# Altium schematic sheet connect.SchDoc
size B; SheetNumber: 6; SheetTotal: 6
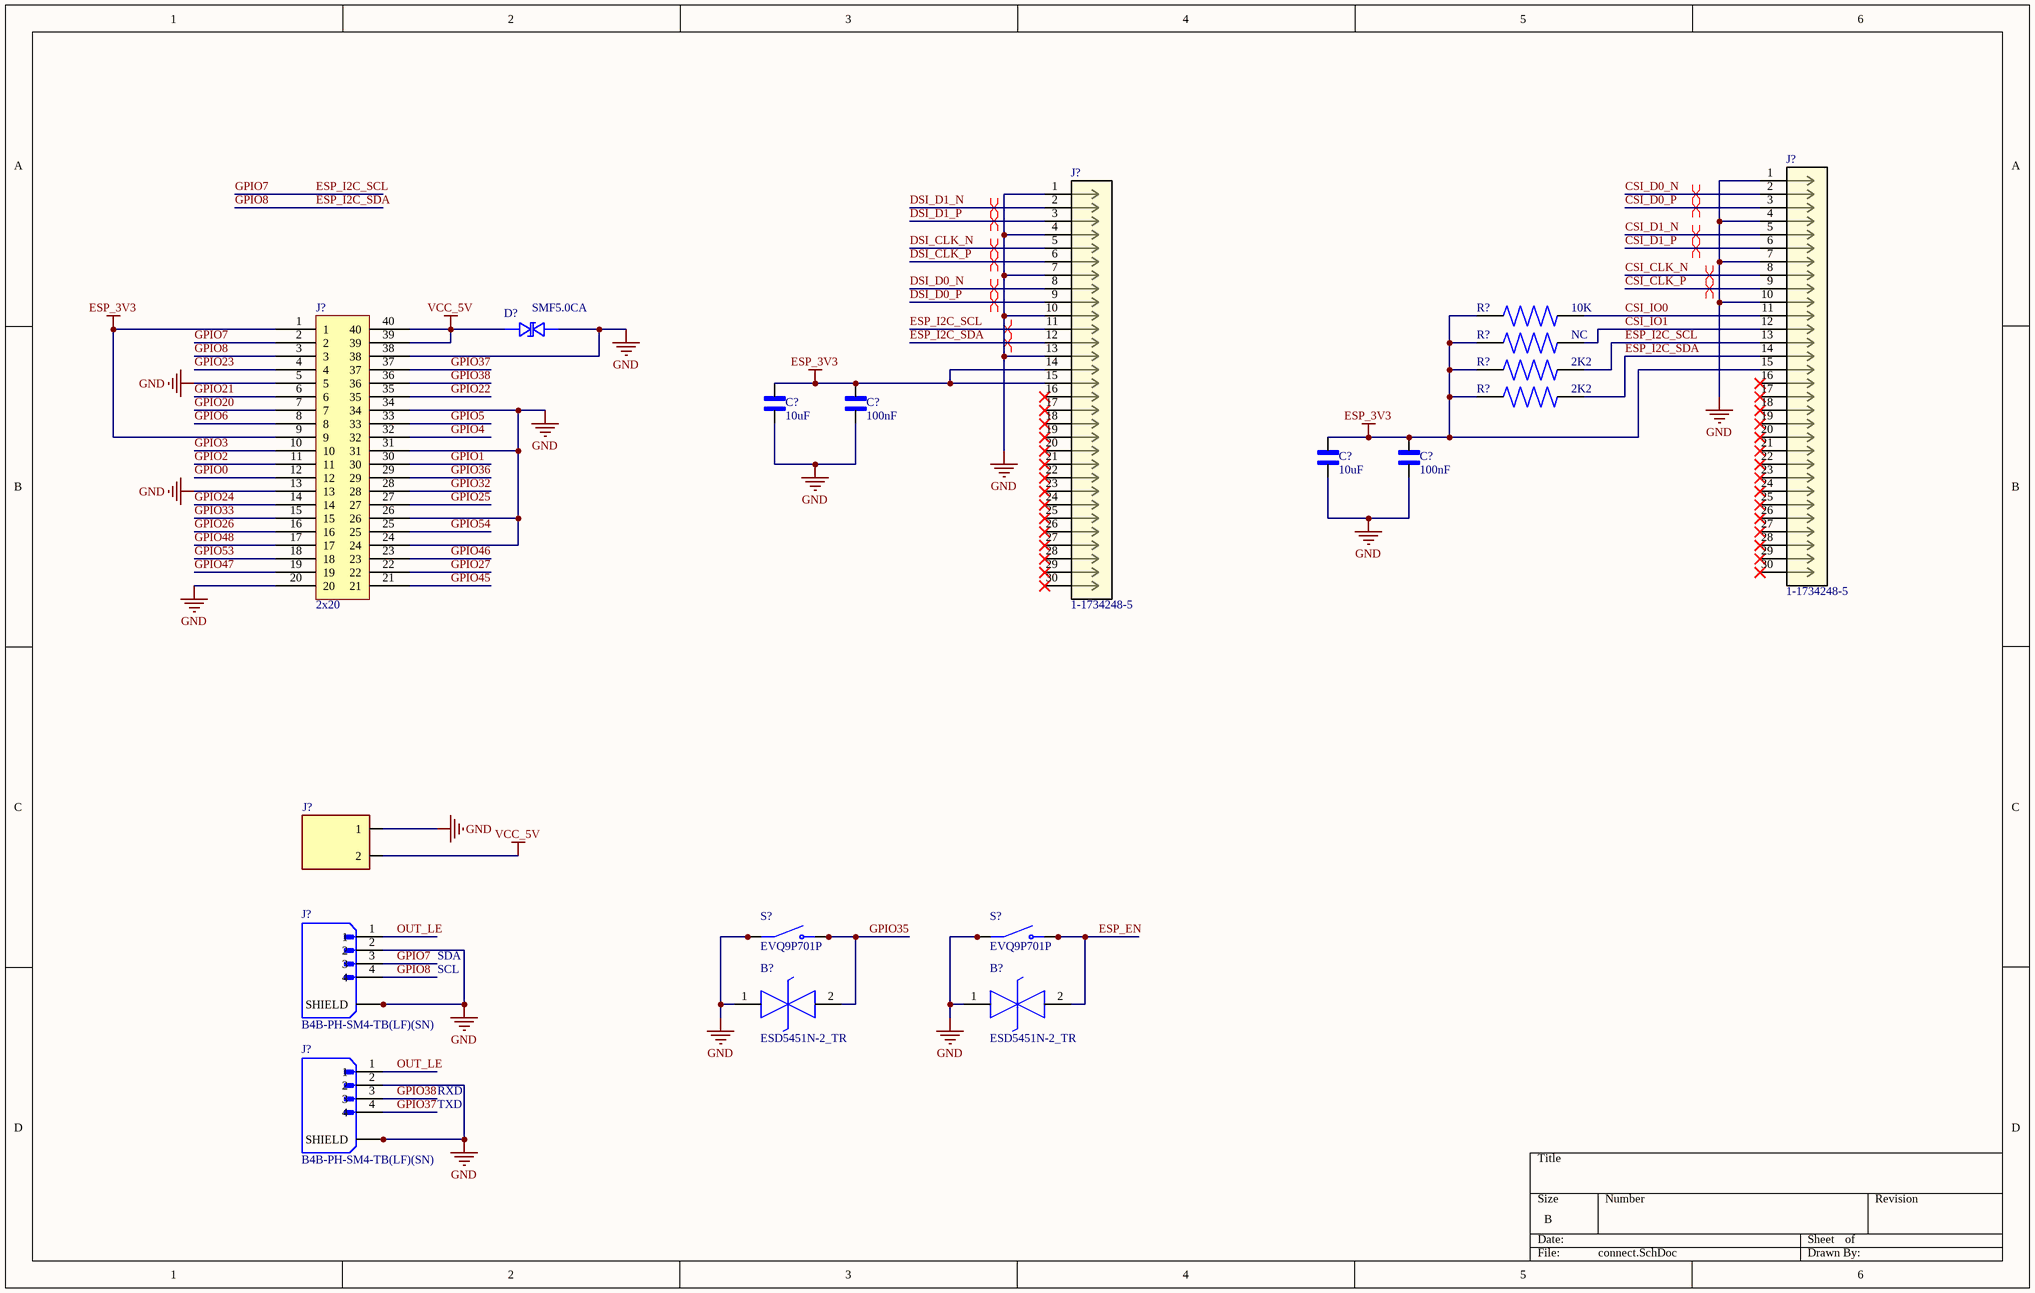
[diagram p0: connect.SchDoc]

## Parts
(Parts that share a designator on the sheet are numbered #1, #2 ... from top to bottom, then left to right.)
B?#1  ESD5451N-2_TR  [ESD5451N2TR]
B?#2  ESD5451N-2_TR  [ESD5451N2TR]
C?#1  10uF  [CAPC1005X61N]
C?#2  100nF  [CAPC1005X61N]
C?#3  10uF  [CAPC1005X61N]
C?#4  100nF  [CAPC1005X61N]
D?  SMF5.0CA  [SOD-123FL]
J?#1  1-1734248-5  [conn30_1-1734248-5_TEC]
J?#2  1-1734248-5  [conn30_1-1734248-5_TEC]
J?#3  2x20  [2x40]
J?#4  B2B-PH-SM4-TB(LF)(SN)  [SM4-CON]  (value not drawn)
J?#5  B4B-PH-SM4-TB(LF)(SN)  [JST_B4B-PH-SM4-TB(LF)(SN)]
J?#6  B4B-PH-SM4-TB(LF)(SN)  [JST_B4B-PH-SM4-TB(LF)(SN)]
R?#1  10K  [RES_ERJU02F5102X]
R?#2  NC  [RES_ERJU02F5102X]
R?#3  2K2  [RES_ERJU02F5102X]
R?#4  2K2  [RES_ERJU02F5102X]
S?#1  EVQ9P701P  [SW_EVQ9P701P]
S?#2  EVQ9P701P  [SW_EVQ9P701P]

## Nets
ESP_3V3: C?#1.1 C?#2.1 C?#3.1 C?#4.1 J?#1.15 J?#2.14 J?#2.15 J?#3.1 J?#3.9 R?#1.2 R?#2.2 R?#3.2 R?#4.2
GND: B?#1.1(K1) B?#2.1(K1) C?#1.2 C?#2.2 C?#3.2 C?#4.2 D?.P$2 J?#1.1 J?#1.4 J?#1.7 J?#1.10 J?#2.1 J?#2.4 J?#2.7 J?#2.10 J?#2.13 J?#3.5 J?#3.13 J?#3.20 J?#3.24 J?#3.26 J?#3.31 J?#3.34 J?#3.38 J?#4.1 J?#5.2 J?#5.SH1(SHIELD) J?#5.SH2(SHIELD) J?#6.2 J?#6.SH1(SHIELD) J?#6.SH2(SHIELD) S?#1.2_A(NC) S?#1.2_B(NC) S?#2.2_A(NC) S?#2.2_B(NC)
VCC_5V: D?.P$1 J?#3.39 J?#3.40 J?#4.2
CSI_CLK_N: J?#1.8
CSI_CLK_P: J?#1.9
CSI_D0_N: J?#1.2
CSI_D0_P: J?#1.3
CSI_D1_N: J?#1.5
CSI_D1_P: J?#1.6
CSI_IO0: J?#1.11 R?#1.1
CSI_IO1: J?#1.12 R?#2.1
DSI_CLK_N: J?#2.5
DSI_CLK_P: J?#2.6
DSI_D0_N: J?#2.8
DSI_D0_P: J?#2.9
DSI_D1_N: J?#2.2
DSI_D1_P: J?#2.3
ESP_EN: B?#2.2(K2) S?#2.1_A(NO) S?#2.1_B(NO)
ESP_I2C_SCL: J?#1.13 J?#2.11 J?#3.2 J?#5.3 R?#3.1  [also labelled GPIO7]
ESP_I2C_SDA: J?#1.14 J?#2.12 J?#3.3 J?#5.4 R?#4.1  [also labelled GPIO8]
GPIO0: J?#3.12
GPIO1: J?#3.30
GPIO2: J?#3.11
GPIO3: J?#3.10
GPIO4: J?#3.32
GPIO5: J?#3.33
GPIO6: J?#3.8
GPIO20: J?#3.7
GPIO21: J?#3.6
GPIO22: J?#3.35
GPIO23: J?#3.4
GPIO24: J?#3.14
GPIO25: J?#3.27
GPIO26: J?#3.16
GPIO27: J?#3.22
GPIO32: J?#3.28
GPIO33: J?#3.15
GPIO35: B?#1.2(K2) S?#1.1_A(NO) S?#1.1_B(NO)
GPIO36: J?#3.29
GPIO37: J?#3.37 J?#6.4
GPIO38: J?#3.36 J?#6.3
GPIO45: J?#3.21
GPIO46: J?#3.23
GPIO47: J?#3.19
GPIO48: J?#3.17
GPIO53: J?#3.18
GPIO54: J?#3.25
OUT_LE: J?#5.1 J?#6.1

Not connected (* = marked no-connect by the designer): J?#1 16* 17* 18* 19* 20* 21* 22* 23* 24* 25* 26* 27* 28* 29* 30*; J?#2 16* 17* 18* 19* 20* 21* 22* 23* 24* 25* 26* 27* 28* 29* 30*

## Layout directives
differential pair: CSI_CLK_N, CSI_CLK_P, CSI_D0_N, CSI_D0_P, CSI_D1_N, CSI_D1_P, DSI_CLK_N, DSI_CLK_P, DSI_D0_N, DSI_D0_P, DSI_D1_N, DSI_D1_P, ESP_I2C_SCL, ESP_I2C_SDA

## Notes on the sheet
- SDA
- SCL
- RXD
- TXD

## Library data of the parts
B?#1 B?#2 = ESD5451N-2_TR: 1-Line, Bi-directional, Transient Voltage Suppressors; Manufacturer_Name: Will Semiconductor; Manufacturer_Part_Number: ESD5451N-2/TR; Geometry.Height: 0.53mm; Mouser Part Number: *; Mouser Price/Stock: *; Arrow Part Number: *; Arrow Price/Stock: *; Datasheet Link: https://lcsc.com/datasheet/lcsc_datasheet_2410121433_WILLSEMI-Will-Semicon-ESD5451N-2-TR_C239604.pdf
C?#1-C?#4 = cap_0402_VJ0402D100MXCAP: cap 0402; MF: Vishay Vitramon; SnapEDA_Link: https://www.snapeda.com/parts/VJ0402D100MXCAP/Vishay/view-part/?ref=snap; Package: 1005 Vishay Vitramon; Value: *; MP: VJ0402D100MXCAP; Check_prices: https://www.snapeda.com/parts/VJ0402D100MXCAP/Vishay/view-part/?ref=eda
D? = SMF5.0CA: 9.2V Clamp 21.7A Ipp Tvs Diode Surface Mount SOD-123F; MF: Littelfuse Inc.; SnapEDA_Link: https://www.snapeda.com/parts/SMF5.0CA/Littelfuse/view-part/?ref=snap; Package: SOD-123F Littelfuse; Value: *; MP: SMF5.0CA; Check_prices: https://www.snapeda.com/parts/SMF5.0CA/Littelfuse/view-part/?ref=eda
J?#1 J?#2 = 1-1734248-5: 1.0 FPC, ZIF V/T, SMT, 15P; Manufacturer_Name: TE Connectivity; TYPE: Receptacle; Copyright: Copyright (C) 2026 Ultra Librarian. All rights reserved.; Manufacturer_Part_Number: 1-1734248-5; RefDes: RefDes
J?#3 = 2x20: 40-pin dual-row male header, 2×20 configuration, 2.54mm pitch, through-hole mounting
J?#4 = B2B-PH-SM4-TB(LF)(SN): Connector Header Surface Mount 2 position 0.079 (2.00mm); MF: JST Sales; SnapEDA_Link: https://www.snapeda.com/parts/B2B-PH-SM4-TB(LF)(SN)/JST+Sales+America+Inc./view-part/?ref=snap; Package: NON STANDARD-2 JST; Value: *; MP: B2B-PH-SM4-TB(LF)(SN); Check_prices: https://www.snapeda.com/parts/B2B-PH-SM4-TB(LF)(SN)/JST+Sales+America+Inc./view-part/?ref=eda
J?#5 J?#6 = B4B-PH-SM4-TB(LF)(SN): Connector Header Surface Mount 4 position 0.079 (2.00mm); MF: JST Sales; SnapEDA_Link: https://www.snapeda.com/parts/B4B-PH-SM4-TB(LF)(SN)/JST+Sales+America+Inc./view-part/?ref=snap; Package: NON STANDARD-4 JST; Value: *; MP: B4B-PH-SM4-TB(LF)(SN); Check_prices: https://www.snapeda.com/parts/B4B-PH-SM4-TB(LF)(SN)/JST+Sales+America+Inc./view-part/?ref=eda
R?#1-R?#4 = res_0402_ERJU02F5102X: Availability: Unavailable; MP: ERJU02F5102X; Price: None; Package: None; Value: *
S?#1 S?#2 = EVQ9P701P: MF: {'manufacturer': u'Panasonic Electronic Components'}; Package: None; Price: None; Value: *; MP: EVQ9P701P; Availability: Unavailable